# Altium schematic sheet Power_Section.SchDoc
size A4; DocumentNumber: 2; SheetNumber: 2; SheetTotal: 5
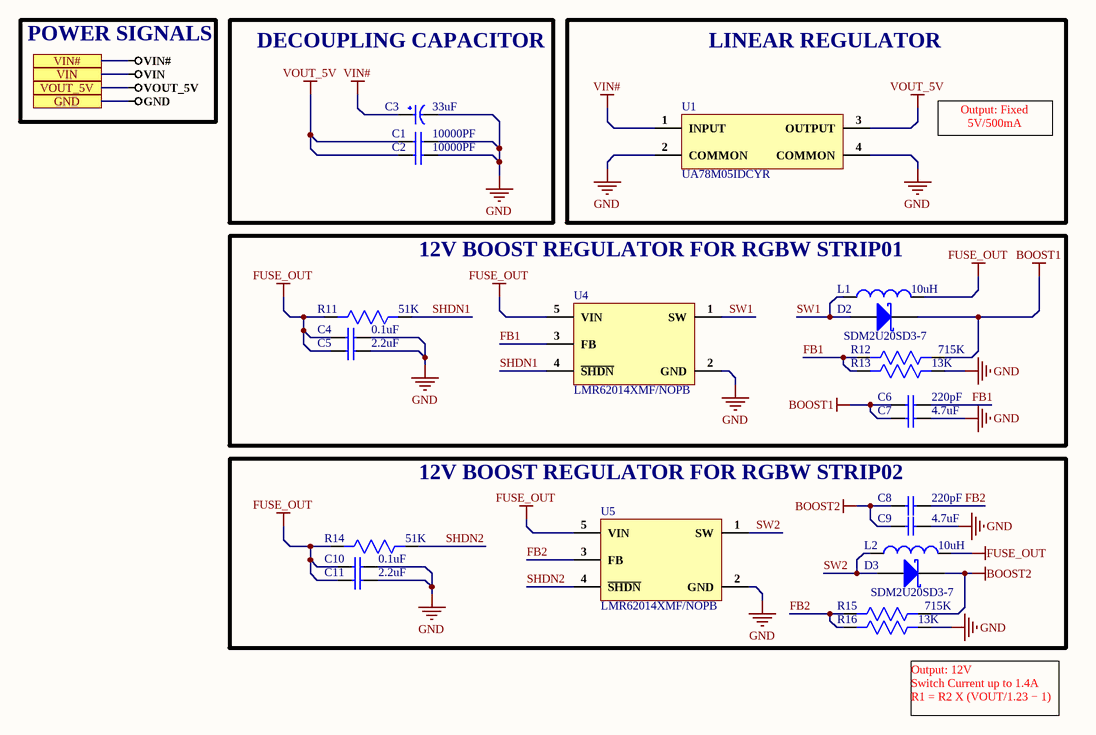
[diagram p0: Power_Section.SchDoc]

## Parts
C1  10000PF  [Cap1206]
C2  10000PF  [Cap1206]
C3  33uF  [EEE-HB1E330AP]
C4  0.1uF  [CAP 0201]
C5  2.2uF  [Cap0402]
C6  220pF  [CAP 0201]
C7  4.7uF  [Cap0603]
C8  220pF  [CAP 0201]
C9  4.7uF  [Cap0603]
C10  0.1uF  [CAP 0201]
C11  2.2uF  [Cap0402]
D2  SDM2U20SD3-7  [SDM2U20SD3-7]
D3  SDM2U20SD3-7  [SDM2U20SD3-7]
L1  10uH  [SPM5012T-100M-LR]
L2  10uH  [SPM5012T-100M-LR]
R11  51K  [Res-0201]
R12  715K  [Res-0201]
R13  13K  [Res-0201]
R14  51K  [Res-0201]
R15  715K  [Res-0201]
R16  13K  [Res-0201]
U1  UA78M05IDCYR  [UA78M05IDCYR]
U4  LMR62014XMF/NOPB  [SOT23-5]
U5  LMR62014XMF/NOPB  [SOT23-5]

## Blocks framed on the sheet
DECOUPLING CAPACITOR: C1-C3
LINEAR REGULATOR: U1
12V BOOST REGULATOR FOR RGBW STRIP01: C4-C7 D2 L1 R11-R13 U4
12V BOOST REGULATOR FOR RGBW STRIP02: C8-C11 D3 L2 R14-R16 U5

## Ports
GND, VIN, VIN#, VOUT_5V

## Nets
BOOST1: C6.1 C7.1 D2.2(K) R12.2
BOOST2: C8.1 C9.1 D3.2(K) R15.2
FUSE_OUT: C4.1 C5.1 C10.1 C11.1 L1.2 L2.2 R11.1 R14.1 U4.5(VIN) U5.5(VIN)
GND: C1.2 C2.2 C3.2 C4.2 C5.2 C7.2 C9.2 C10.2 C11.2 R13.2 R16.2 U1.2(COMMON) U1.4(COMMON) U4.2(GND) U5.2(GND) ; port GND
VIN: port VIN
VIN#: C3.1 U1.1(INPUT) ; port VIN#
VOUT_5V: C1.1 C2.1 U1.3(OUTPUT) ; port VOUT_5V
FB1: C6.2 R12.1 R13.1 U4.3(FB)
FB2: C8.2 R15.1 R16.1 U5.3(FB)
SHDN1: R11.2 U4.4(~{SH}~{DN})
SHDN2: R14.2 U5.4(~{SH}~{DN})
SW1: D2.1(A) L1.1 U4.1(SW)
SW2: D3.1(A) L2.1 U5.1(SW)

## Notes on the sheet
- POWER SIGNALS
- Output: Fixed 5V/500mA
- Output: 12V
  Switch Current up to 1.4A
  R1 = R2 X (VOUT/1.23 − 1)

## Library data of the parts
C1 C2 = CC1206KRX7R0BB103: CAP CER 10000PF 100V X7R 1206; Manufacturer: Yageo; Capacitance: 10nF; Tolerance: 10%; Dissipation Factor: 2.5%; Insulation Resistance: 10GR; Supplier 1: Digi-Key; Manufacturer Part Number: CC1206KRX7R0BB103; RoHS: Yes; Category: Ceramic Capacitors; Stock 1: 7045; Pricing 1: 1=0.28000, 10=0.18900, 50=0.11320, 100=0.09560, 500=0.06542, 1000=0.05787 (USD); Mount: Surface Mount; Case/Package: 1206; Number of Pins: 2; Case Code (Imperial): 1206; Case Code (Metric): 3216; Min Operating Temperature: -55°C; Max Operating Temperature: 125°C; Dielectric: X7R; Voltage: 100V; Series: CC; Voltage Rating: 100V; Voltage Rating (DC): 100V; Packaging: Tape and Reel; Package Quantity: 4000; Termination: SMD/SMT; Resistor Type: Ceramic; Length: 3.2mm; Width: 1.6mm; Height: 0.85mm; Depth: 1.6mm; Thickness: 0.057inch; Radiation Hardening: No; Lead Free: Lead Free; RoHS Compliant: Yes; ComponentLink1URL: https://datasheet.ciiva.com/15375/upy-gp-np0-16v-to-50v-8-15375877.pdf?src-supplier=Mouser; ComponentLink1Description: https://datasheet.ciiva.com/15375/upy-gp-np0-16v-to-50v-8-15375877.pdf?src-supplier=Mouser; ComponentLink2URL: https://datasheet.ciiva.com/16744/upy-np0x7r-mv-100-to-630v-9-16744582.pdf?src-supplier=Future+Electronics; ComponentLink2Description: https://datasheet.ciiva.com/16744/upy-np0x7r-mv-100-to-630v-9-16744582.pdf?src-supplier=Future+Electronics; ComponentLink3URL: https://datasheet.ciiva.com/15189/getdatasheetpartid-315568-15189269.pdf?src-supplier=Verical; ComponentLink3Description: https://datasheet.ciiva.com/15189/getdatasheetpartid-315568-15189269.pdf?src-supplier=Verical; ComponentLink4URL: https://datasheet.ciiva.com/16624/upy-np0x7r-mv-100-to-630v-9-16624629.pdf?src-supplier=Avnet+Europe; ComponentLink4Description: https://datasheet.ciiva.com/16624/upy-np0x7r-mv-100-to-630v-9-16624629.pdf?src-supplier=Avnet+Europe; ComponentLink5URL: https://datasheet.ciiva.com/11466/upy-np0x7r-mv-100-to-630v-9-11466717.pdf?src-supplier=Avnet; ComponentLink5Description: https://datasheet.ciiva.com/11466/upy-np0x7r-mv-100-to-630v-9-11466717.pdf?src-supplier=Avnet; Supplier Part Number 1: 311-1985-1-ND
C3 = EEE-HB1E330AP: CAP ALUM 33UF 20% 25V SMD; Manufacturer: Panasonic; Ripple Current: 65mA; Life (Hours): 2000Hour; Leakage Current: 3uA; Supplier 1: Digi-Key; Manufacturer Part Number: EEE-HB1E330AP; RoHS: Yes; Category: Aluminum Electrolytic Capacitors; Stock 1: 27; Pricing 1: 1=0.52000, 10=0.35900, 50=0.25160, 100=0.21560, 500=0.16172 (USD); Mount: Surface Mount; Case/Package: Radial; Min Operating Temperature: -40°C; Max Operating Temperature: 105°C; Capacitance: 33uF; Tolerance: 20%; Voltage Rating: 25V; Packaging: Tape and Reel; Package Quantity: 1; Voltage Rating (DC): 25V; Termination: SMD/SMT; Voltage: 25V; Series: HB; Construction: Cylindrical; Diameter: 6.3mm; Length: 6.1mm; Height: 5.8mm; Height - Seated (Max): 0.228inch; Radiation Hardening: No; Lead Free: Lead Free; RoHS Compliant: Yes; ComponentLink1URL: https://datasheet.ciiva.com/11780/0900766b80bed47d-11780811.pdf?src-supplier=RSComponents; ComponentLink1Description: https://datasheet.ciiva.com/11780/0900766b80bed47d-11780811.pdf?src-supplier=RSComponents; ComponentLink2URL: https://datasheet.ciiva.com/2985/aba0000ce117-2985840.pdf?src-supplier=Avnet; ComponentLink2Description: https://datasheet.ciiva.com/2985/aba0000ce117-2985840.pdf?src-supplier=Avnet; ComponentLink3URL: https://datasheet.ciiva.com/17536/aba0000ce117-17536184.pdf?src-supplier=Avnet+Europe; ComponentLink3Description: https://datasheet.ciiva.com/17536/aba0000ce117-17536184.pdf?src-supplier=Avnet+Europe; ComponentLink4URL: https://datasheet.ciiva.com/10331/aba0000ce117-10331117.pdf?src-supplier=Avnet; ComponentLink4Description: https://datasheet.ciiva.com/10331/aba0000ce117-10331117.pdf?src-supplier=Avnet; Supplier Part Number 1: PCE4755CT-ND
C4 C10 = GRM033R61E104KE14D: CAP CER 0.1UF 25V X5R 0201; Manufacturer: Murata; Capacitance: 100nF; Tolerance: 10%; Supplier 1: Mouser; Manufacturer Part Number: GRM033R61E104KE14D; RoHS: Yes; Category: Ceramic Capacitors; Stock 1: 19728; Pricing 1: 1=0.12000, 10=0.05600, 50=0.05600, 100=0.02500, 1000=0.01400, 10000=0.01100 (USD); Mount: Surface Mount; Case/Package: 0201; Case Code (Metric): 0603; Case Code (Imperial): 0201; Weight: 1.2E-05oz; Min Operating Temperature: -55°C; Max Operating Temperature: 85°C; Packaging: Tape and Reel; Voltage Rating: 25V; Dielectric: X5R; Termination: SMD/SMT; Resistor Type: Ceramic; Voltage Rating (DC): 25V; Package Quantity: 15000; Length: 0.024inch; Width: 0.012inch; Height: 0.3mm; Thickness: 0.013inch; Lead Free: Lead Free; RoHS Compliant: Yes; ComponentLink1URL: http://www.farnell.com/datasheets/2867843.pdf?src-supplier=Farnell; ComponentLink1Description: http://www.farnell.com/datasheets/2867843.pdf?src-supplier=Farnell; ComponentLink2URL: http://www.mouser.com/ds/2/281/c02e-2905.pdf?src-supplier=Mouser; ComponentLink2Description: http://www.mouser.com/ds/2/281/c02e-2905.pdf?src-supplier=Mouser; ComponentLink3URL: http://search.murata.co.jp/Ceramy/image/img/A01X/G101/ENG/GRM033R61E104KE14-01.pdf?src-supplier=Digi-Key; ComponentLink3Description: http://search.murata.co.jp/Ceramy/image/img/A01X/G101/ENG/GRM033R61E104KE14-01.pdf?src-supplier=Digi-Key; ComponentLink4URL: http://www.farnell.com/datasheets/2867843.pdf?src-supplier=Newark; ComponentLink4Description: http://www.farnell.com/datasheets/2867843.pdf?src-supplier=Newark; Supplier Part Number 1: 81-GRM033R61E104KE4D
C5 C11 = C1005X5R1E225KT000E: CAP CER 2.2UF 25V X5R 0402; Manufacturer: TDK; Manufacturer Part Number: C1005X5R1E225K050BC; Dielectric Material: Ceramic; Tolerance: 10%; Supplier 1: Digi-Key; RoHS: Yes; Category: Ceramic Capacitors; Stock 1: 655450; Pricing 1: 1=0.31000, 10=0.21000, 50=0.13980, 100=0.11890, 500=0.08390, 1000=0.07342, 2500=0.06992, 5000=0.06468 (USD); Mount: Surface Mount; Case/Package: 0402; Case Code (Imperial): 0402; Case Code (Metric): 1005; Weight: 2.3E-05oz; Min Operating Temperature: -55°C; Max Operating Temperature: 85°C; Capacitance: 2.2uF; Voltage Rating (DC): 25V; Packaging: Tape and Reel; Package Quantity: 1; Voltage Rating: 25V; Dielectric: X5R; Termination: SMD/SMT; Resistor Type: Ceramic; Series: C; Length: 1mm; Width: 0.5mm; Height: 0.5mm; Thickness: 0.022inch; Depth: 0.5mm; REACH SVHC: No SVHC; Lead Free: Lead Free; RoHS Compliant: Yes; ComponentLink1URL: https://datasheet.ciiva.com/24217/c1005x5r1e225k050bc-264404-24217075.pdf?src-supplier=Mouser; ComponentLink1Description: https://datasheet.ciiva.com/24217/c1005x5r1e225k050bc-264404-24217075.pdf?src-supplier=Mouser; ComponentLink2URL: https://datasheet.ciiva.com/6276/tdkmlcccaprange-6276808.pdf?src-supplier=Digi-Key; ComponentLink2Description: https://datasheet.ciiva.com/6276/tdkmlcccaprange-6276808.pdf?src-supplier=Digi-Key; ComponentLink3URL: https://datasheet.ciiva.com/6276/tdkmlcccaprange-6276806.pdf?src-supplier=Digi-Key; ComponentLink3Description: https://datasheet.ciiva.com/6276/tdkmlcccaprange-6276806.pdf?src-supplier=Digi-Key; ComponentLink4URL: https://datasheet.ciiva.com/6276/tdkmlcccaprange-6276810.pdf?src-supplier=Digi-Key; ComponentLink4Description: https://datasheet.ciiva.com/6276/tdkmlcccaprange-6276810.pdf?src-supplier=Digi-Key; Supplier Part Number 1: 445-9090-1-ND
C6 C8 = C0603X7R221KGT: 50V 220pF X7R ±10% 0201 Multilayer Ceramic Capacitors MLCC - SMD/SMT ROHS; Manufacturer: Darfon Elec; Manufacturer Part No:: C0603X7R221KGT; Value: 220pF; Footprint: 0201; ComponentLink1Description: New link; ComponentLink1URL: https://www.lcsc.com/product-detail/Multilayer-Ceramic-Capacitors-MLCC-SMD-SMT_Darfon-Elec-C0603X7R221KGT_C258475.html
C7 C9 = C1608X5R1E475K080AC: CAP CER 4.7UF 25V X5R 0603; Manufacturer: TDK; Dielectric Material: Ceramic; Tolerance: 10%; Supplier 1: Digi-Key; Manufacturer Part Number: C1608X5R1E475K080AC; RoHS: Yes; Category: Ceramic Capacitors; Stock 1: 495198; Pricing 1: 1=0.36000, 10=0.25000, 50=0.17460, 100=0.14970, 500=0.11230, 1000=0.09483 (USD); Mount: Surface Mount; Case/Package: 0603; Case Code (Metric): 1608; Case Code (Imperial): 0603; Weight: 7.1E-05oz; Min Operating Temperature: -55°C; Max Operating Temperature: 85°C; Termination: SMD/SMT; Packaging: Tape and Reel; Capacitance: 4.7uF; Voltage Rating: 25V; Voltage Rating (DC): 25V; Package Quantity: 4000; Dielectric: X5R; Resistor Type: Ceramic; Length: 1.6mm; Width: 0.031inch; Height: 0.8mm; Thickness: 0.039inch; Depth: 0.8mm; REACH SVHC: No SVHC; Lead Free: Lead Free; ComponentLink1URL: https://datasheet.ciiva.com/48587/6print-detail-pdf-phplangenpart-noc1608x5r1e475k080acimp-unit-xmhz-48587141.pdf?src-supplier=Onlinecomponents.com; ComponentLink1Description: https://datasheet.ciiva.com/48587/6print-detail-pdf-phplangenpart-noc1608x5r1e475k080acimp-unit-xmhz-48587141.pdf?src-supplier=Onlinecomponents.com; ComponentLink2URL: https://datasheet.ciiva.com/24216/mlcc-commercial-general-en-24216326.pdf?src-supplier=Mouser; ComponentLink2Description: https://datasheet.ciiva.com/24216/mlcc-commercial-general-en-24216326.pdf?src-supplier=Mouser; ComponentLink3URL: https://datasheet.ciiva.com/48671/mlcc-commercial-general-en-48671304.pdf?src-supplier=Avnet; ComponentLink3Description: https://datasheet.ciiva.com/48671/mlcc-commercial-general-en-48671304.pdf?src-supplier=Avnet; Supplier Part Number 1: 445-9050-1-ND
D2 D3 = SDM2U20SD3-7: DIODE SCHOTTKY 20V 2A SOD323; Manufacturer: Diodes; Supplier 1: Digi-Key; Manufacturer Part Number: SDM2U20SD3-7; RoHS: Yes; Category: Rectifier Diodes; Stock 1: 6; Pricing 1: 1=0.47000, 10=0.35200, 100=0.19930, 500=0.13200, 1000=0.10120 (USD); Mount: Surface Mount; Packaging: Cut Tape; Average Rectified Current: 2A; Max Reverse Voltage (DC): 20V; RoHS Compliant: Yes; ComponentLink1URL: http://www.mouser.com/ds/2/115/SDM2U20SD3-537776.pdf?src-supplier=Mouser; ComponentLink1Description: http://www.mouser.com/ds/2/115/SDM2U20SD3-537776.pdf?src-supplier=Mouser; ComponentLink2URL: https://www.diodes.com/assets/Datasheets/SDM2U20SD3.pdf?src-supplier=Digi-Key; ComponentLink2Description: https://www.diodes.com/assets/Datasheets/SDM2U20SD3.pdf?src-supplier=Digi-Key; ComponentLink3URL: http://diodes.com/datasheets/SDM2U20SD3.pdf?src-supplier=Avnet; ComponentLink3Description: http://diodes.com/datasheets/SDM2U20SD3.pdf?src-supplier=Avnet; Supplier Part Number 1: SDM2U20SD3-7DICT-ND
L1 L2 = SPM5012T-100M-LR: FIXED IND 10UH 1.3A 390.5MOHM SM; Manufacturer: TDK; Core Material: Metal; Saturation Current: 2.2A; Shielding: Shielded; DC Resistance (DCR): 390.5mR; Test Frequency: 100kHz; Tolerance: 20%; Supplier 1: Digi-Key; Manufacturer Part Number: SPM5012T-100M-LR; RoHS: Yes; Category: Fixed Inductors; Stock 1: 765; Pricing 1: 1=1.50000, 10=1.39400, 25=1.28720, 50=1.07240, 100=1.00820, 250=0.90088, 500=0.77220 (USD); Mount: Surface Mount; Case/Package: Nonstandard; Min Operating Temperature: -40°C; Max Operating Temperature: 125°C; Packaging: Tape and Reel; Resistor Type: Wirewound; Inductance: 10uH; Current Rating: 1.3A; Length: 0.126inch; Width: 0.118inch; Height - Seated (Max): 0.047inch; RoHS Compliant: Yes; ComponentLink1URL: https://product.tdk.com/info/en/catalog/datasheets/inductor_commercial_power_spm5012-lr_en.pdf?src-supplier=Digi-Key; ComponentLink1Description: https://product.tdk.com/info/en/catalog/datasheets/inductor_commercial_power_spm5012-lr_en.pdf?src-supplier=Digi-Key; Supplier Part Number 1: 445-174487-1-ND
R11 R14 = 0201WMF5102TEE: 51kΩ 0201 Chip Resistor; Manufacturer: Uni Royal; Manufacturer Part No:: 0201WMF5102TEE; Value: 51K; Footprint: 0201; ComponentLink1Description: New link; ComponentLink1URL: https://www.lcsc.com/product-detail/Chip-span-style-background-color-ff0-Resistor-span-Surface-Mount_UNI-ROYAL-Uniroyal-Elec-0201WMF5102TEE_C473471.html
R12 R15 = 0201WMF7153TEE: 715kΩ 0201 Chip Resistor; Manufacturer: Uni Royal; Manufacturer Part No:: 0201WMF7153TEE; Footprint: 0201; Value: 715K; ComponentLink1Description: New link; ComponentLink1URL: https://www.lcsc.com/product-detail/Chip-Resistor-Surface-Mount_UNI-ROYAL-Uniroyal-Elec-0201WMF7153TEE_C620454.html
R13 R16 = NQ01WMJ0133TEE: 13kΩ 0201 Chip Resistor; Manufacturer: Uni Royal; Manufacturer Part No:: NQ01WMJ0133TEE; Footprint: 0201; Value: 13K; ComponentLink1Description: New link; ComponentLink1URL: https://lcsc.com/product-detail/Chip-Resistor-Surface-Mount_UNI-ROYAL-Uniroyal-Elec-NQ01WMJ0133TEE_C965341.html
U1 = UA78M05IDCYR: IC REG LINEAR 5V 500MA SOT223-4; Manufacturer: Texas Instruments; Number of Outputs: 1; Min Input Voltage: 7V; Max Input Voltage: 25V; Dropout Voltage: 2V; Polarity: Positive; Quiescent Current: 4.5mA; Output Type: Fixed; Power Supply Rejection Ratio (PSRR): 80dB; Supplier 1: Digi-Key; Manufacturer Part Number: UA78M05IDCYR; RoHS: Yes; Category: Voltage Regulators - Linear; Pricing 1: 1=0.80000, 10=0.70000, 25=0.65720, 100=0.53640, 250=0.49820, 500=0.42400, 1000=0.35000 (USD); Mount: Surface Mount; Case/Package: SOT-223-4; Number of Pins: 4; Weight: 0.006632oz; Min Operating Temperature: -40°C; Max Operating Temperature: 125°C; Output Current: 500mA; Packaging: Tape and Reel; Max Output Current: 500mA; Output Voltage: 5V; Package Quantity: 1; Number of Regulators: 1; Series: -; Nominal Output Voltage: 5V; Lead Free: Lead Free; RoHS Compliant: Yes; REACH SVHC: No SVHC; ComponentLink1URL: https://datasheet.ciiva.com/46429/1849874-46429894.pdf?src-supplier=Element14; ComponentLink1Description: https://datasheet.ciiva.com/46429/1849874-46429894.pdf?src-supplier=Element14; ComponentLink2URL: https://datasheet.ciiva.com/14274/ua78m05-14274743.pdf?src-supplier=Avnet; ComponentLink2Description: https://datasheet.ciiva.com/14274/ua78m05-14274743.pdf?src-supplier=Avnet; ComponentLink3URL: https://datasheet.ciiva.com/2042/ua78m05-2042251.pdf?src-supplier=Digi-Key; ComponentLink3Description: https://datasheet.ciiva.com/2042/ua78m05-2042251.pdf?src-supplier=Digi-Key; ComponentLink4URL: https://datasheet.ciiva.com/2042/ua78m05-2042252.pdf?src-supplier=Digi-Key; ComponentLink4Description: https://datasheet.ciiva.com/2042/ua78m05-2042252.pdf?src-supplier=Digi-Key; ComponentLink5URL: https://datasheet.ciiva.com/2042/ua78m05-2042253.pdf?src-supplier=Digi-Key; ComponentLink5Description: https://datasheet.ciiva.com/2042/ua78m05-2042253.pdf?src-supplier=Digi-Key; Supplier Part Number 1: 296-17616-6-ND
U4 U5 = LMR62014XMF/NOPB: IC REG BOOST ADJ 2A SOT23-5; Manufacturer: TI National Semiconductor; Output Type: Adjustable; Output Configuration: Positive; Switching Frequency: 1.6MHz; Max Output Current: 1.4A; Min Input Voltage: 2.7V; Max Input Voltage: 14V; Number of Outputs: 1; Output Voltage: 20V; Quiescent Current: 2mA; Min Output Voltage: 3V; Synchronous Rectifier: No; Supplier 1: Digi-Key; Manufacturer Part Number: LMR62014XMF/NOPB; RoHS: Yes; Category: Power Supply Modules; Stock 1: 5493; Pricing 1: 1=0.96000, 10=0.86000, 25=0.81600, 100=0.67040, 250=0.62672, 500=0.55384 (USD); Mount: Surface Mount; Case/Package: SOT-23-5; Number of Pins: 5; Contact Plating: Tin,Matte; Min Operating Temperature: -40°C; Max Operating Temperature: 125°C; Output Current: 1.4A; Packaging: Tape and Reel; Package Quantity: 1000; Topology: Boost; Max Output Voltage: 20V; Radiation Hardening: No; REACH SVHC: No SVHC; Lead Free: Lead Free; ComponentLink1URL: https://datasheet.ciiva.com/3231/lmr62014-3231410.pdf?src-supplier=Avnet; ComponentLink1Description: https://datasheet.ciiva.com/3231/lmr62014-3231410.pdf?src-supplier=Avnet; ComponentLink2URL: https://datasheet.ciiva.com/23854/1777788-23854326.pdf?src-supplier=Newark; ComponentLink2Description: https://datasheet.ciiva.com/23854/1777788-23854326.pdf?src-supplier=Newark; ComponentLink3URL: https://datasheet.ciiva.com/4879/snvs735a-74121-4879731.pdf?src-supplier=Mouser; ComponentLink3Description: https://datasheet.ciiva.com/4879/snvs735a-74121-4879731.pdf?src-supplier=Mouser; ComponentLink4URL: https://datasheet.ciiva.com/22669/1716576-22669414.pdf?src-supplier=Element14; ComponentLink4Description: https://datasheet.ciiva.com/22669/1716576-22669414.pdf?src-supplier=Element14; ComponentLink5URL: https://datasheet.ciiva.com/6603/lmr62014-6603804.pdf?src-supplier=Digi-Key; ComponentLink5Description: https://datasheet.ciiva.com/6603/lmr62014-6603804.pdf?src-supplier=Digi-Key; ComponentLink6URL: https://datasheet.ciiva.com/6603/lmr62014-6603807.pdf?src-supplier=Digi-Key; ComponentLink6Description: https://datasheet.ciiva.com/6603/lmr62014-6603807.pdf?src-supplier=Digi-Key; Supplier Part Number 1: LMR62014XMF/NOPBCT-ND